# Altium schematic sheet a0206-2006.13.SchDoc
size 558 x 431 mm
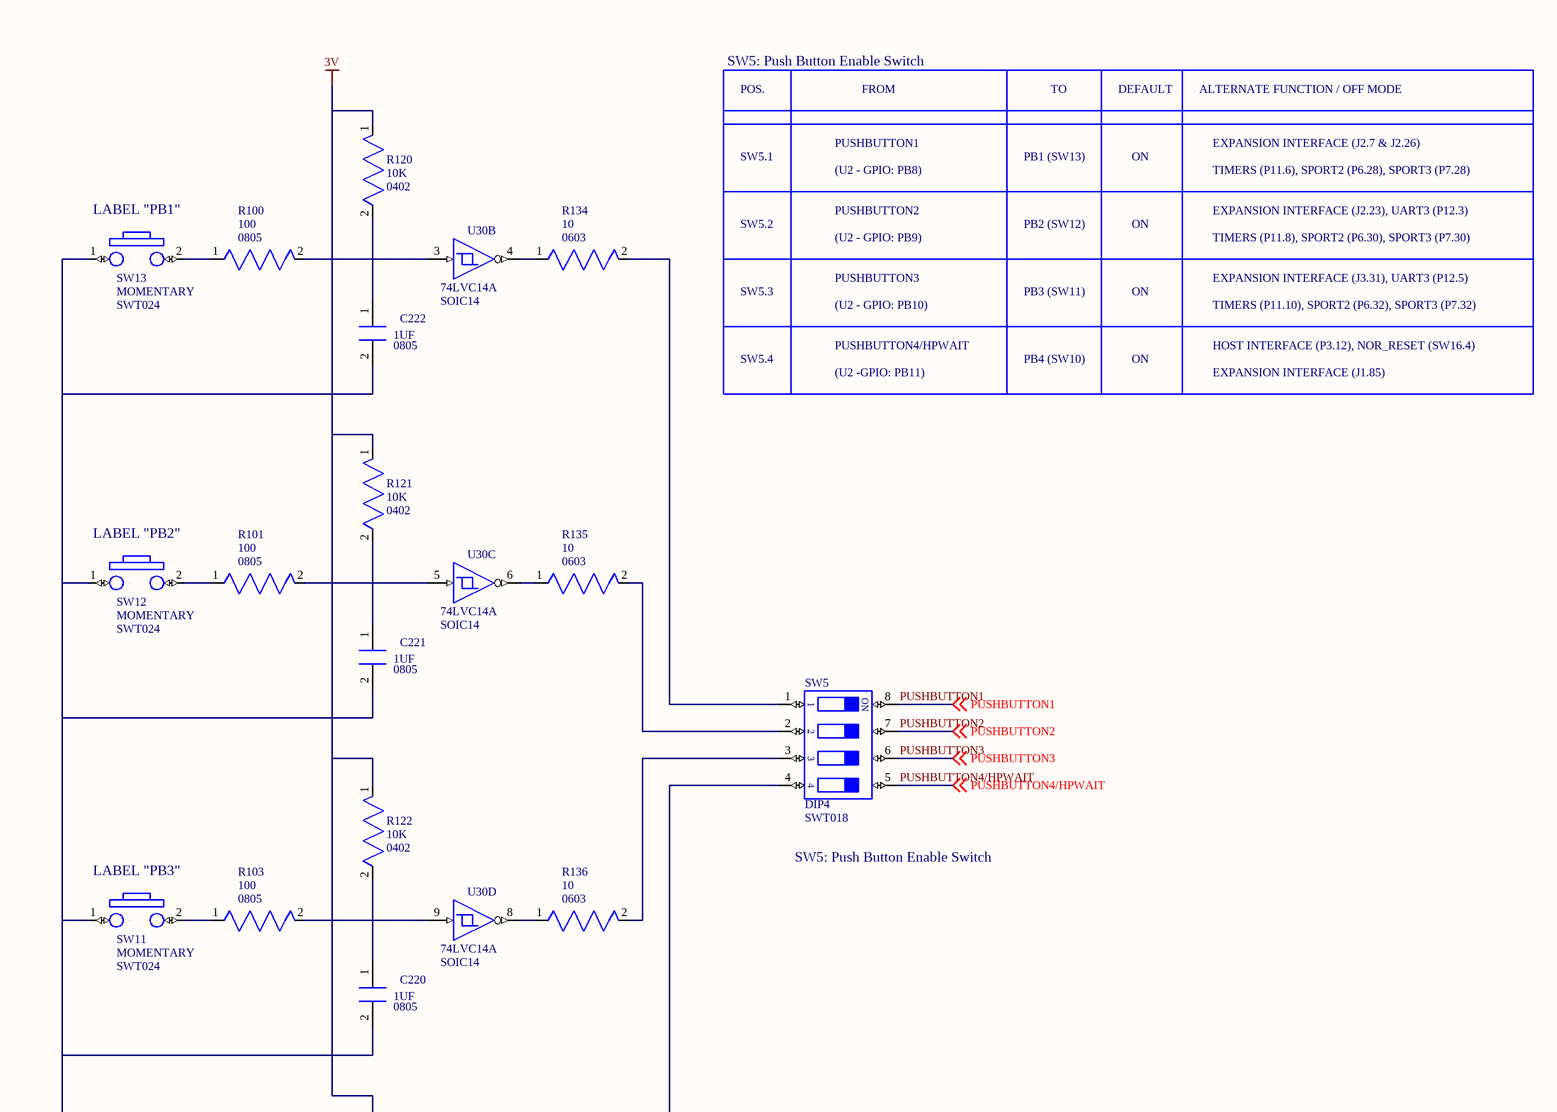
[diagram p0: a0206-2006.13.SchDoc, top left]
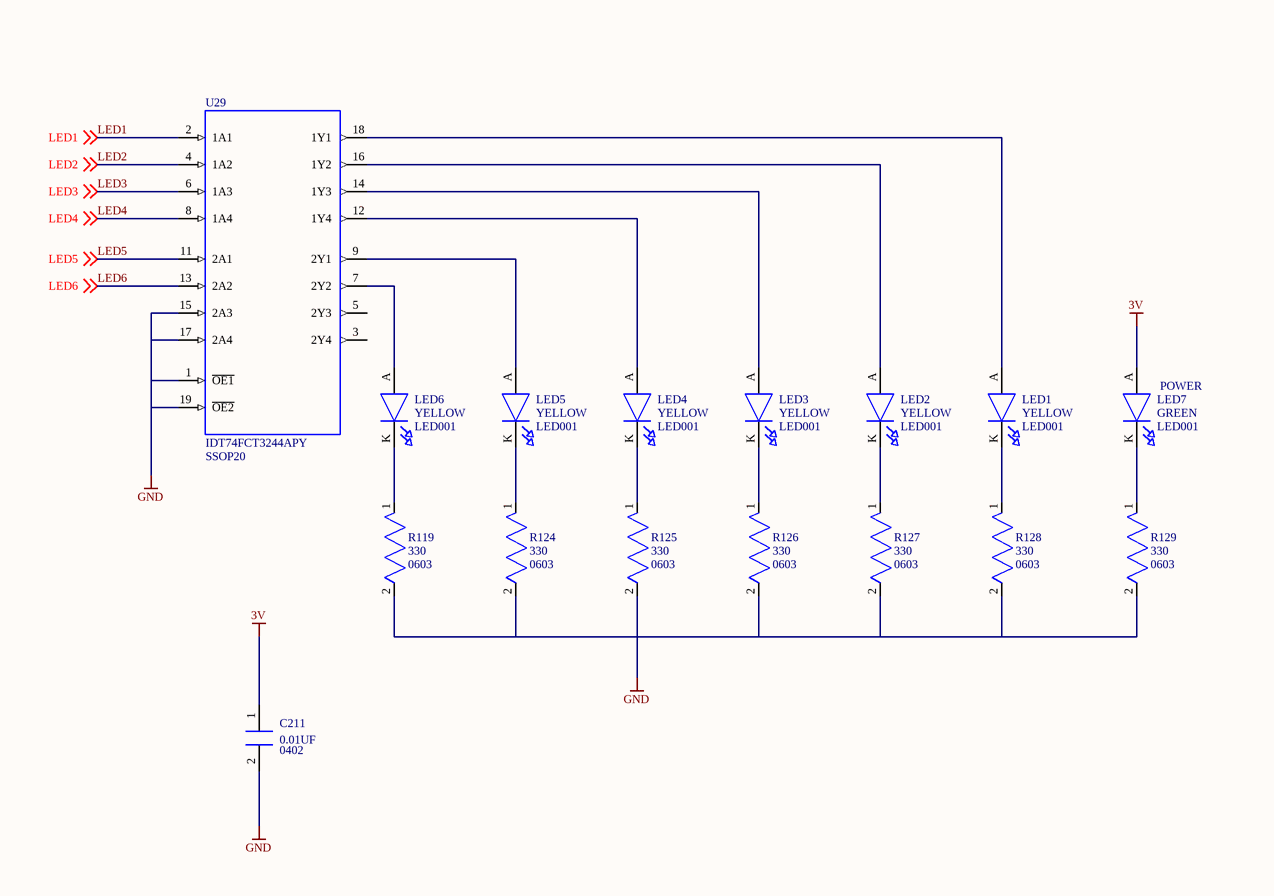
[diagram p1: a0206-2006.13.SchDoc, top right]
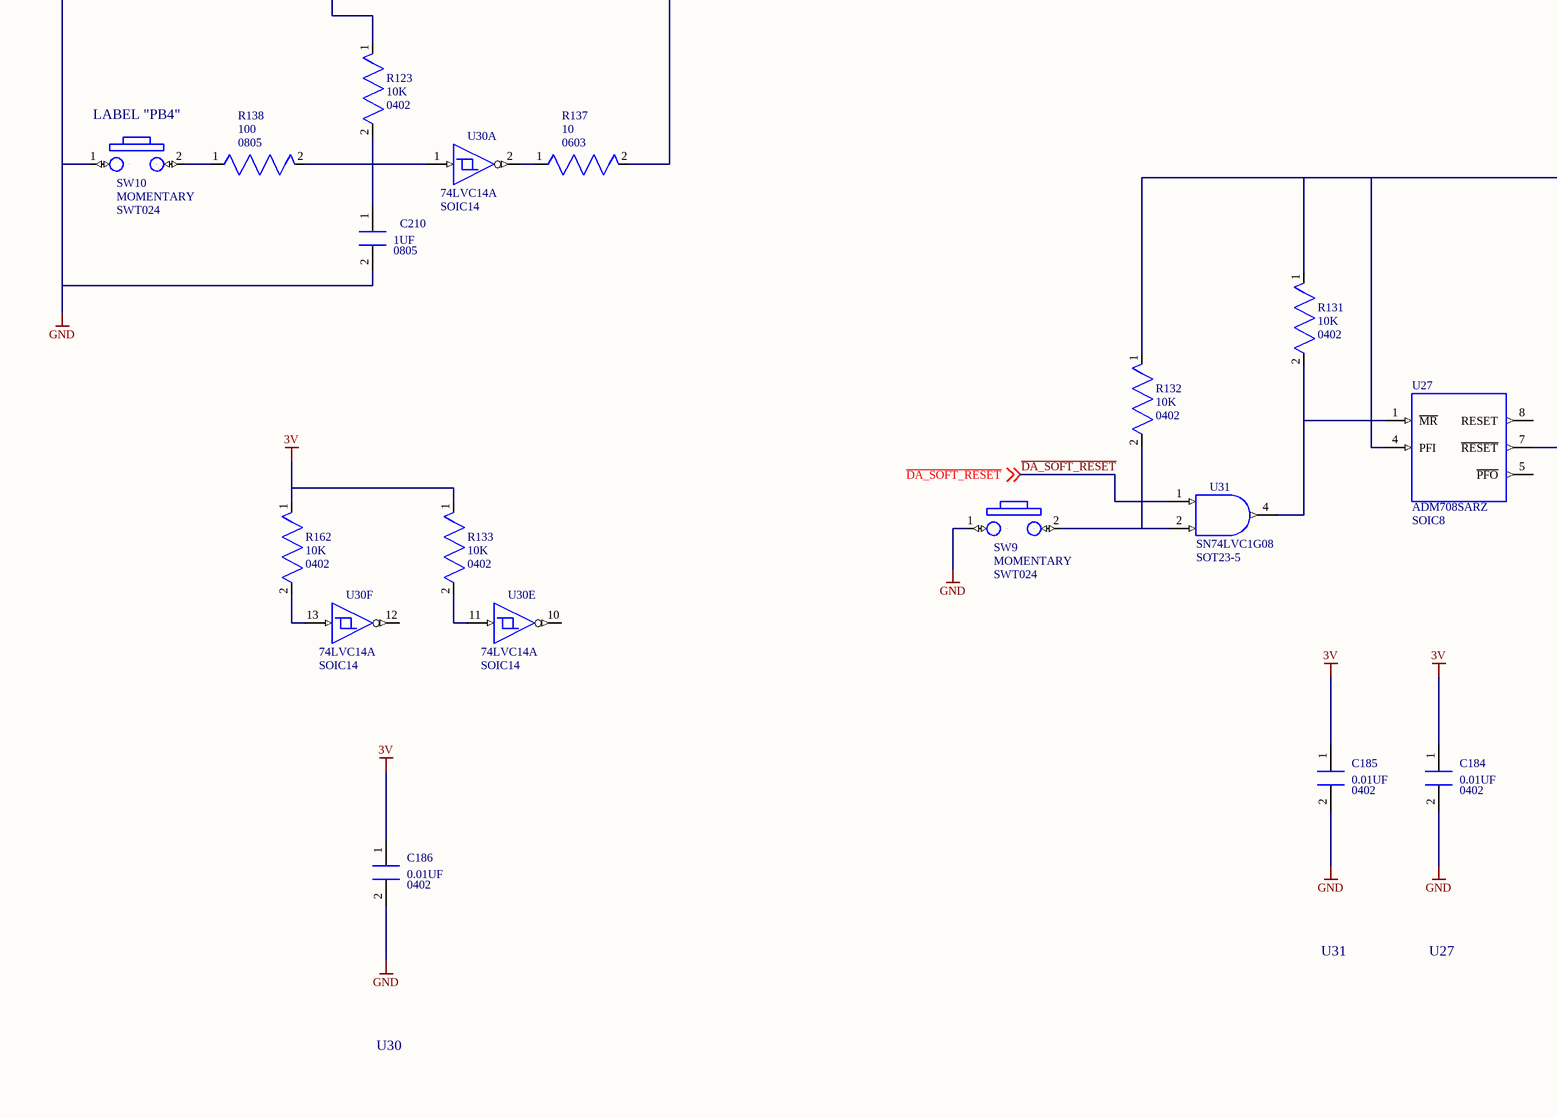
[diagram p2: a0206-2006.13.SchDoc, bottom left]
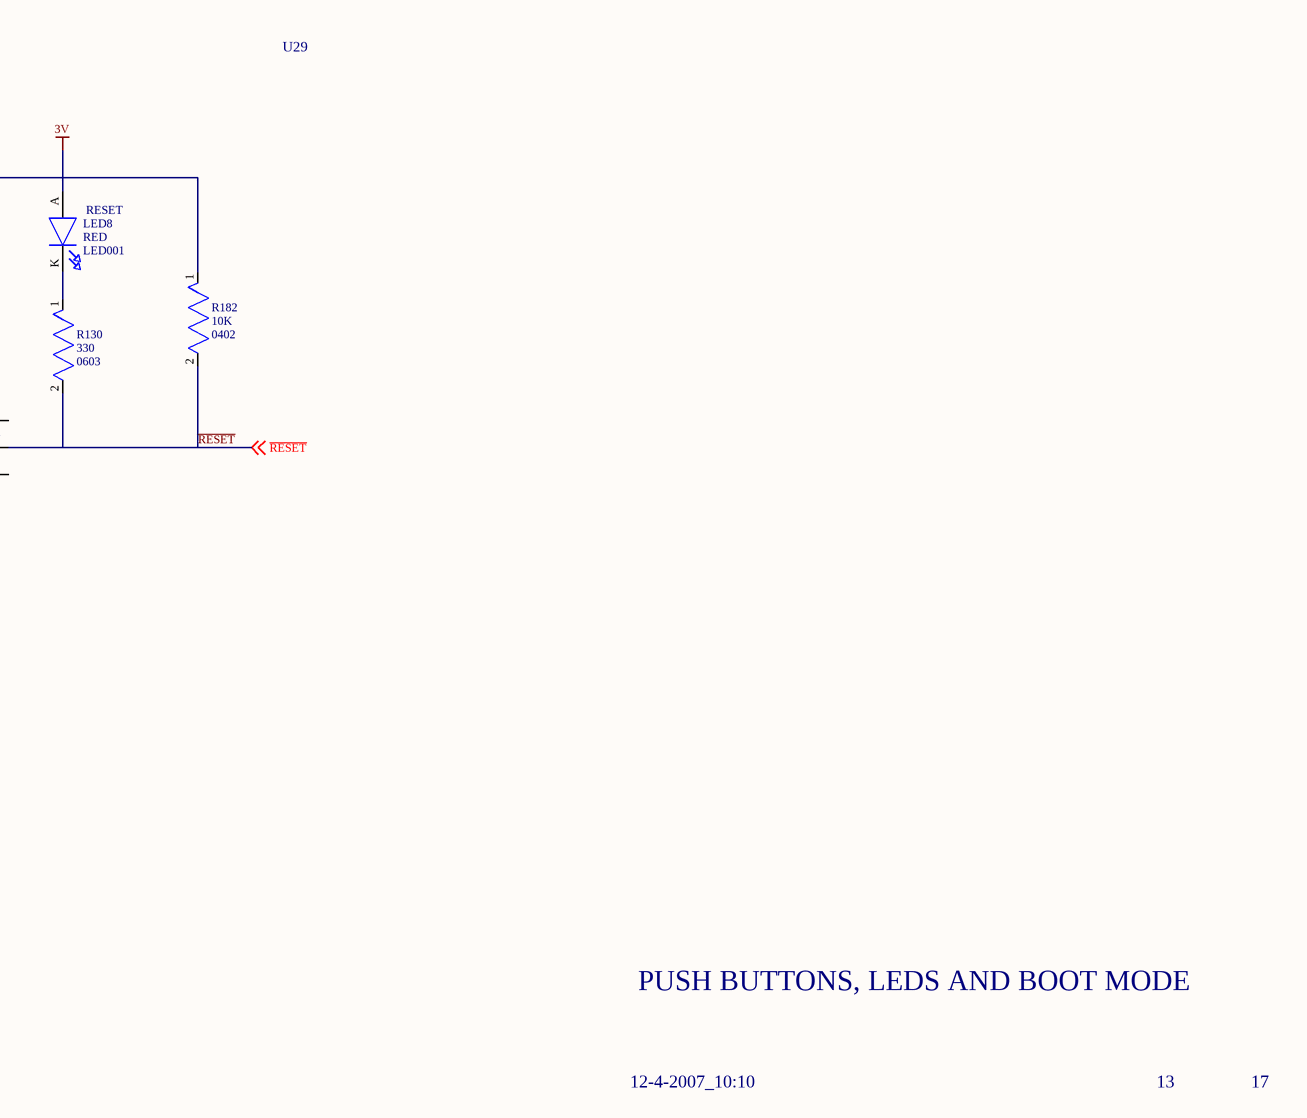
[diagram p3: a0206-2006.13.SchDoc, bottom right]

## Parts
C184  value 0.01UF  [0402]  (hidden comment: *)
C185  value 0.01UF  [0402]  (hidden comment: *)
C186  value 0.01UF  [0402]  (hidden comment: *)
C210  value 1UF  [0805]  (hidden comment: *)
C211  value 0.01UF  [0402]  (hidden comment: *)
C220  value 1UF  [0805]  (hidden comment: *)
C221  value 1UF  [0805]  (hidden comment: *)
C222  value 1UF  [0805]  (hidden comment: *)
LED1  value YELLOW  [LED001]  (hidden comment: *)
LED2  value YELLOW  [LED001]  (hidden comment: *)
LED3  value YELLOW  [LED001]  (hidden comment: *)
LED4  value YELLOW  [LED001]  (hidden comment: *)
LED5  value YELLOW  [LED001]  (hidden comment: *)
LED6  value YELLOW  [LED001]  (hidden comment: *)
LED7  value GREEN  [LED001]  (hidden comment: *)
LED8  value RED  [LED001]  (hidden comment: *)
R100  value 100  [0805]  (hidden comment: *)
R101  value 100  [0805]  (hidden comment: *)
R103  value 100  [0805]  (hidden comment: *)
R119  value 330  [0603]  (hidden comment: *)
R120  value 10K  [0402]  (hidden comment: *)
R121  value 10K  [0402]  (hidden comment: *)
R122  value 10K  [0402]  (hidden comment: *)
R123  value 10K  [0402]  (hidden comment: *)
R124  value 330  [0603]  (hidden comment: *)
R125  value 330  [0603]  (hidden comment: *)
R126  value 330  [0603]  (hidden comment: *)
R127  value 330  [0603]  (hidden comment: *)
R128  value 330  [0603]  (hidden comment: *)
R129  value 330  [0603]  (hidden comment: *)
R130  value 330  [0603]  (hidden comment: *)
R131  value 10K  [0402]  (hidden comment: *)
R132  value 10K  [0402]  (hidden comment: *)
R133  value 10K  [0402]  (hidden comment: *)
R134  value 10  [0603]  (hidden comment: *)
R135  value 10  [0603]  (hidden comment: *)
R136  value 10  [0603]  (hidden comment: *)
R137  value 10  [0603]  (hidden comment: *)
R138  value 100  [0805]  (hidden comment: *)
R162  value 10K  [0402]  (hidden comment: *)
R182  value 10K  [0402]  (hidden comment: *)
SW5  value DIP4  [SWT018]  (hidden comment: *)
SW9  value MOMENTARY  [SWT024]  (hidden comment: *)
SW10  value MOMENTARY  [SWT024]  (hidden comment: *)
SW11  value MOMENTARY  [SWT024]  (hidden comment: *)
SW12  value MOMENTARY  [SWT024]  (hidden comment: *)
SW13  value MOMENTARY  [SWT024]  (hidden comment: *)
U27  PART: ADM708SARZ  [SOIC8]  (hidden comment: *)
U29  PART: IDT74FCT3244APY  [SSOP20]  (hidden comment: *)
U30  PART: 74LVC14A  [SOIC14]  (hidden comment: *)  (parts A,B,C,D,E,F of 6)
U31  PART: SN74LVC1G08  [SOT23-5]  (hidden comment: *)

## Nets
3V: C184.1(A) C185.1(A) C186.1(A) C211.1(A) LED7.A(ANODE) LED8.A(ANODE) R120.1(N1) R121.1(N1) R122.1(N1) R123.1(N1) R131.1(N1) R132.1(N1) R133.1(N1) R162.1(N1) R182.1(N1) U27.4(PFI) U27.2(3V) U29.20(3V) U30.14(3V) U31.5(3V)
GND: C184.2(B) C185.2(B) C186.2(B) C210.2(B) C211.2(B) C220.2(B) C221.2(B) C222.2(B) R119.2(N2) R124.2(N2) R125.2(N2) R126.2(N2) R127.2(N2) R128.2(N2) R129.2(N2) SW9.1 SW10.1 SW11.1 SW12.1 SW13.1 U27.3(GND) U29.1(~{OE1}) U29.10(GND) U29.15(2A3) U29.17(2A4) U29.19(~{OE2}) U30.7(GND) U31.3(GND)
~{DA_SOFT_RESET}: U31.1(A) ; off-sheet ~{DA_SOFT_RESET}
LED1: U29.2(1A1) ; off-sheet LED1
LED2: U29.4(1A2) ; off-sheet LED2
LED3: U29.6(1A3) ; off-sheet LED3
LED4: U29.8(1A4) ; off-sheet LED4
LED5: U29.11(2A1) ; off-sheet LED5
LED6: U29.13(2A2) ; off-sheet LED6
PUSHBUTTON1: SW5.8 ; off-sheet PUSHBUTTON1
PUSHBUTTON2: SW5.7 ; off-sheet PUSHBUTTON2
PUSHBUTTON3: SW5.6 ; off-sheet PUSHBUTTON3
PUSHBUTTON4/HPWAIT: SW5.5 ; off-sheet PUSHBUTTON4/HPWAIT
~{RESET}: R130.2(N2) R182.2(N2) U27.7(~{RESET}) ; off-sheet ~{RESET}
NetC210_1: C210.1(A) R123.2(N2) R138.2(N2) U30.1(A)
NetC220_1: C220.1(A) R103.2(N2) R122.2(N2) U30.9(A)
NetC221_1: C221.1(A) R101.2(N2) R121.2(N2) U30.5(A)
NetC222_1: C222.1(A) R100.2(N2) R120.2(N2) U30.3(A)
NetLED1_A: LED1.A(ANODE) U29.18(1Y1)
NetLED1_K: LED1.K(CATHODE) R128.1(N1)
NetLED2_A: LED2.A(ANODE) U29.16(1Y2)
NetLED2_K: LED2.K(CATHODE) R127.1(N1)
NetLED3_A: LED3.A(ANODE) U29.14(1Y3)
NetLED3_K: LED3.K(CATHODE) R126.1(N1)
NetLED4_A: LED4.A(ANODE) U29.12(1Y4)
NetLED4_K: LED4.K(CATHODE) R125.1(N1)
NetLED5_A: LED5.A(ANODE) U29.9(2Y1)
NetLED5_K: LED5.K(CATHODE) R124.1(N1)
NetLED6_A: LED6.A(ANODE) U29.7(2Y2)
NetLED6_K: LED6.K(CATHODE) R119.1(N1)
NetLED7_K: LED7.K(CATHODE) R129.1(N1)
NetLED8_K: LED8.K(CATHODE) R130.1(N1)
NetR100_1: R100.1(N1) SW13.2
NetR101_1: R101.1(N1) SW12.2
NetR103_1: R103.1(N1) SW11.2
NetR131_2: R131.2(N2) U27.1(~{MR}) U31.4(Y)
NetR132_2: R132.2(N2) SW9.2 U31.2(B)
NetR133_2: R133.2(N2) U30.11(A)
NetR134_1: R134.1(N1) U30.4(Y)
NetR134_2: R134.2(N2) SW5.1
NetR135_1: R135.1(N1) U30.6(Y)
NetR135_2: R135.2(N2) SW5.2
NetR136_1: R136.1(N1) U30.8(Y)
NetR136_2: R136.2(N2) SW5.3
NetR137_1: R137.1(N1) U30.2(Y)
NetR137_2: R137.2(N2) SW5.4
NetR138_1: R138.1(N1) SW10.2
NetR162_2: R162.2(N2) U30.13(A)

Not connected (* = marked no-connect by the designer): U27 5(~{PFO}) 6 8(RESET); U29 3(2Y4) 5(2Y3); U30 10(Y) 12(Y)

## Notes on the sheet
- SW5: Push Button Enable Switch
- POS.
- FROM
- TO
- DEFAULT
- ALTERNATE FUNCTION / OFF MODE
- SW5.1
- PUSHBUTTON1
- PB1 (SW13)
- ON
- EXPANSION INTERFACE (J2.7 & J2.26)
- LABEL "PB1"
- SW5.2
- PUSHBUTTON2
- (U2 - GPIO: PB8)
- PB2 (SW12)
- TIMERS (P11.6), SPORT2 (P6.28), SPORT3 (P7.28)
- EXPANSION INTERFACE (J2.23), UART3 (P12.3)
- SW5.3
- PUSHBUTTON3
- (U2 - GPIO: PB9)
- PB3 (SW11)
- TIMERS (P11.8), SPORT2 (P6.30), SPORT3 (P7.30)
- EXPANSION INTERFACE (J3.31), UART3 (P12.5)
- SW5.4
- PUSHBUTTON4/HPWAIT
- (U2 - GPIO: PB10)
- PB4 (SW10)
- HOST INTERFACE (P3.12), NOR_RESET (SW16.4)
- TIMERS (P11.10), SPORT2 (P6.32), SPORT3 (P7.32)
- (U2 -GPIO: PB11)
- EXPANSION INTERFACE (J1.85)
- LABEL "PB2"
- (near LED7) POWER
- LABEL "PB3"
- U29
- LABEL "PB4"
- (near LED8) RESET
- U31
- U27
- PUSH BUTTONS, LEDS AND BOOT MODE
- U30
- 12-4-2007_10:10
- 13
- 17
- A
- B
- C
- D
- 1
- 2
- 3
- 20 Cotton Road
- 4
- DEVICES
- ANALOG
- Nashua, NH 03063
- PH: 1-800-ANALOGD
- Title
- ADSP-BF548 EZ-KIT LITE
- Size
- Board No.
- A0206-2006
- Rev
- 1.4B
- Date
- Sheet
- of
- (in symbol SW_DIP4.1) ON

## Library data of the parts
C184 C186 = CAP_NON_POLARIZED.2: PART_SPEC: CAPACITOR; LEVEL: STD; TYPE: X7R; BOARDS: BOTH; PRT_NUM: 7000279; VOLTAGE: 16V; TOLERANCE: 10%; PKG_TYPE: 0402; ROHS: ROHS
C185 = CAP_NON_POLARIZED.2: PART_SPEC: CAPACITOR; LEVEL: STD; TYPE: X7R; BOARDS: BOTH; TOLERANCE: 10%; VOLTAGE: 16V; PRT_NUM: 7000279; PKG_TYPE: 0402; ROHS: ROHS
C210 = CAP_NON_POLARIZED.2: PART_SPEC: CAPACITOR; LEVEL: STD; TYPE: X7R; BOARDS: BOTH; PRT_NUM: 7000264; VOLTAGE: 10V; TOLERANCE: 10%; PKG_TYPE: 0805; ROHS: ROHS
C211 = CAP_NON_POLARIZED.2: PART_SPEC: CAPACITOR; LEVEL: STD; TYPE: X7R; PRT_NUM: 7000279; VOLTAGE: 16V; TOLERANCE: 10%; BOARDS: BOTH; PKG_TYPE: 0402; ROHS: ROHS
C220 C222 = CAP_NON_POLARIZED.2: PART_SPEC: CAPACITOR; LEVEL: STD; TYPE: X7R; TOLERANCE: 10%; VOLTAGE: 10V; PRT_NUM: 7000264; BOARDS: BOTH; PKG_TYPE: 0805; ROHS: ROHS
C221 = CAP_NON_POLARIZED.2: PART_SPEC: CAPACITOR; LEVEL: STD; TYPE: X7R; PRT_NUM: 7000264; VOLTAGE: 10V; TOLERANCE: 10%; BOARDS: BOTH; PKG_TYPE: 0805; ROHS: ROHS
LED1-LED6 = LED_STANDARD.3: PART_SPEC: LED; LEVEL: STD; BOARDS: BOTH; PRT_NUM: 7000027; PKG_TYPE: LED001; ROHS: ROHS
LED7 = LED_STANDARD.3: PART_SPEC: LED; LEVEL: STD; BOARDS: BOTH; PRT_NUM: 7000499; PKG_TYPE: LED001; ROHS: ROHS
LED8 = LED_STANDARD.3: PART_SPEC: LED; LEVEL: STD; BOARDS: BOTH; PRT_NUM: 7000500; PKG_TYPE: LED001; ROHS: ROHS
R100 R103 = RES_STANDARD.1: PART_SPEC: RESISTOR; LEVEL: STD; POWER: 1/10W; BOARDS: BOTH; PRT_NUM: 7000097; TOLERANCE: 5%; PKG_TYPE: 0805; ROHS: ROHS
R101 = RES_STANDARD.1: PART_SPEC: RESISTOR; LEVEL: STD; POWER: 1/10W; BOARDS: BOTH; TOLERANCE: 5%; PRT_NUM: 7000097; PKG_TYPE: 0805; ROHS: ROHS
R119 R125 R127 R129 R130 = RES_STANDARD.2: PART_SPEC: RESISTOR; LEVEL: STD; POWER: 1/10W; BOARDS: BOTH; PRT_NUM: 7000368; TOLERANCE: 5%; PKG_TYPE: 0603; ROHS: ROHS
R120-R123 R162 = RES_STANDARD.2: PART_SPEC: RESISTOR; LEVEL: STD; POWER: 1/16W; BOARDS: BOTH; TOLERANCE: 5%; PRT_NUM: 7000280; PKG_TYPE: 0402; ROHS: ROHS
R124 R126 R128 = RES_STANDARD.2: PART_SPEC: RESISTOR; LEVEL: STD; POWER: 1/10W; BOARDS: BOTH; TOLERANCE: 5%; PRT_NUM: 7000368; PKG_TYPE: 0603; ROHS: ROHS
R131 R132 R182 = RES_STANDARD.2: PART_SPEC: RESISTOR; LEVEL: STD; POWER: 1/16W; BOARDS: BOTH; PRT_NUM: 7000280; TOLERANCE: 5%; PKG_TYPE: 0402; ROHS: ROHS
R133 = RES_STANDARD.2: PART_SPEC: RESISTOR; LEVEL: STD; POWER: 1/16W; PRT_NUM: 7000280; TOLERANCE: 5%; BOARDS: BOTH; PKG_TYPE: 0402; ROHS: ROHS
R134 R136 = RES_STANDARD.1: PART_SPEC: RESISTOR; LEVEL: STD; POWER: 1/10W; BOARDS: BOTH; TOLERANCE: 5%; PRT_NUM: 7000374; PKG_TYPE: 0603; ROHS: ROHS
R135 R137 = RES_STANDARD.1: PART_SPEC: RESISTOR; LEVEL: STD; POWER: 1/10W; BOARDS: BOTH; PRT_NUM: 7000374; TOLERANCE: 5%; PKG_TYPE: 0603; ROHS: ROHS
R138 = RES_STANDARD.1: PART_SPEC: RESISTOR; LEVEL: STD; TOLERANCE: 5%; PRT_NUM: 7000097; BOARDS: BOTH; POWER: 1/10W; PKG_TYPE: 0805; ROHS: ROHS
SW5 = SW_DIP4.1: 4PIN-SMT-SWT; PART_SPEC: SWITCH; LEVEL: STD; PRT_NUM: 6000144; BOARDS: KIT; PKG_TYPE: SWT018; ROHS: ROHS
SW9-SW13 = SW_MOM_PB.1: 6MM; PART_SPEC: SWITCH; LEVEL: STD; BOARDS: BOTH; PRT_NUM: 6000832; PKG_TYPE: SWT024; ROHS: ROHS
U27 = ICS_ADM708AR.1: VOLTAGE-SUPERVISOR; NC: 6; LEVEL: STD; BOARDS: BOTH; PRT_NUM: 30-024902-01; PKG_TYPE: SOIC8; ROHS: ROHS; WEB: http://www.analog.com/en/prod/0%2C2877%2CADM708%2C00.html
U29 = ICS_SN74XXX244.1: 3.3V-OCTAL-BUFFER; LEVEL: STD; BOARDS: BOTH; PRT_NUM: 1000106; PKG_TYPE: SSOP20; ROHS: ROHS; WEB: http://www.idt.com/?genID
U30 = ICS_SN74XXX14.1: HEX-INVER-SCHMITT-TRIGGER; LEVEL: STD; BOARDS: BOTH; PRT_NUM: 1000097; PKG_TYPE: SOIC14; WEB: http://focus.ti.com/docs/prod/folders/print/sn74lvc14a.html; ROHS: ROHS
U31 = ICS_SN74XXX1G08.1: SINGLE 2-INPUT AND; LEVEL: STD; BOARDS: BOTH; PRT_NUM: 1000287; PKG_TYPE: SOT23-5; ROHS: ROHS; WEB: http://focus.ti.com/docs/prod/folders/print/sn74lvc1g08.html